# Altium project BLE_product-v1.2.PrjPcb
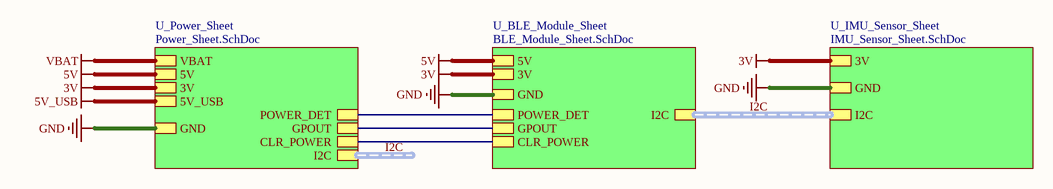
[diagram p0: Top_Sheet.SchDoc]
4 sheets, 45 parts. Net scope: hierarchical (ports join the sheet entries above them; power ports are global).
Board file: BLE_product-v1.2.PcbDoc
Sheets:
  Top_Sheet.SchDoc
    U_BLE_Module_Sheet = BLE_Module_Sheet.SchDoc
    U_IMU_Sensor_Sheet = IMU_Sensor_Sheet.SchDoc
    U_Power_Sheet = Power_Sheet.SchDoc

## Sheet Top_Sheet.SchDoc
size A4; SheetNumber: 1; SheetTotal: 4

### Sub-sheets
U_BLE_Module_Sheet = BLE_Module_Sheet.SchDoc: POWER_DET, 5V, GND, 3V, I2C (harness I2C), CLR_POWER, GPOUT
U_IMU_Sensor_Sheet = IMU_Sensor_Sheet.SchDoc: GND, 3V, I2C (harness I2C)
U_Power_Sheet = Power_Sheet.SchDoc: VBAT, 5V, GND, 3V, POWER_DET, CLR_POWER, 5V_USB, GPOUT, I2C (harness I2C)

### Nets
3V: sheet U_BLE_Module_Sheet/3V, sheet U_IMU_Sensor_Sheet/3V, sheet U_Power_Sheet/3V
5V: sheet U_BLE_Module_Sheet/5V, sheet U_Power_Sheet/5V
GND: sheet U_BLE_Module_Sheet/GND, sheet U_IMU_Sensor_Sheet/GND, sheet U_Power_Sheet/GND
CLR_POWER: sheet U_BLE_Module_Sheet/CLR_POWER, sheet U_Power_Sheet/CLR_POWER
GPOUT: sheet U_BLE_Module_Sheet/GPOUT, sheet U_Power_Sheet/GPOUT
POWER_DET: sheet U_BLE_Module_Sheet/POWER_DET, sheet U_Power_Sheet/POWER_DET

### Buses and harness runs
harness I2C = sheet U_BLE_Module_Sheet/I2C = sheet U_IMU_Sensor_Sheet/I2C
harness I2C = sheet U_Power_Sheet/I2C

### Notes on the sheet
- File:
- Title:
- Date:
- Page
- Num:
- Total:
- Drawn By: Huzaifa Ali

## Sheet BLE_Module_Sheet.SchDoc
size A4; SheetNumber: 3; SheetTotal: 4
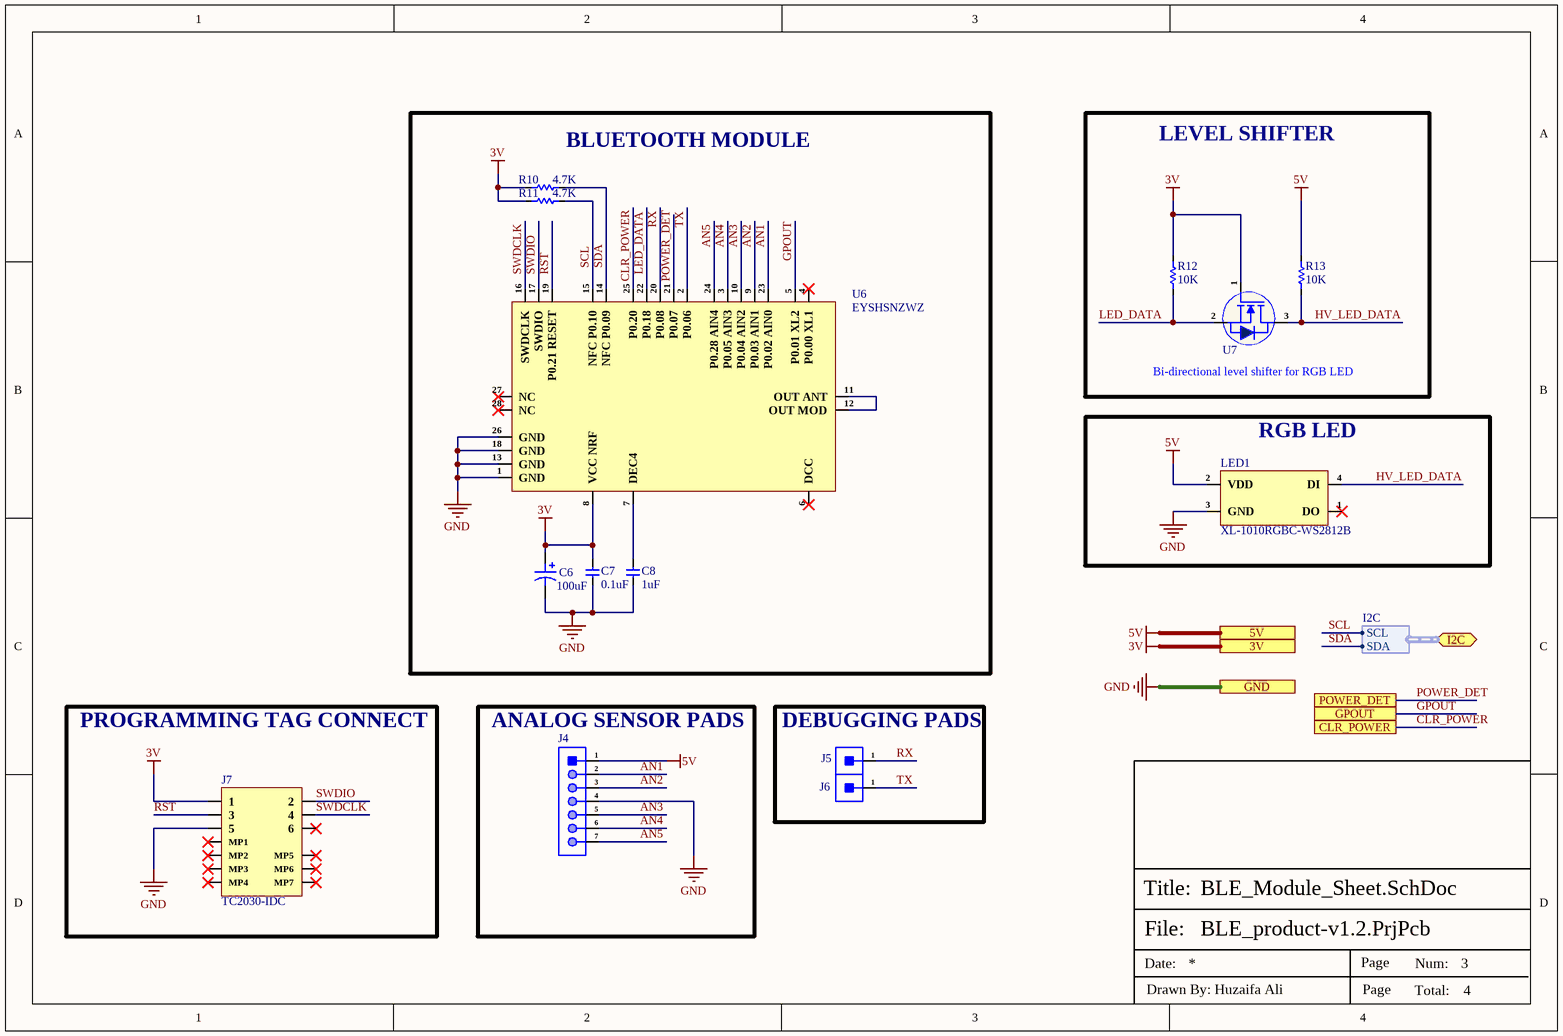
[diagram p1: BLE_Module_Sheet.SchDoc]

### Parts
C6  100uF  [F980J107MMAAXE]
C7  0.1uF  [CAP-0201]
C8  1uF  [CAP-0201]
J4  Sensor Pads 0.5mm Dia  [Sensor-Pads 0.5mm Dia]  (value not drawn)
J5  1 Sensor Pad 0.5mm  [1 Sensor Pad 0.5mm]  (value not drawn)
J6  1 Sensor Pad 0.5mm  [1 Sensor Pad 0.5mm]  (value not drawn)
J7  TC2030-IDC  [TC2030-IDC_]
LED1  XL-1010RGBC-WS2812B  [XL-1010RGBC-WS2812B]
R10  4.7K  [Res-0201]
R11  4.7K  [Res-0201]
R12  10K  [Res-0201]
R13  10K  [Res-0201]
U6  EYSHSNZWZ  [EYSHSNZWZ]
U7  NTNS3193NZT5G  [X-LLGA-3]  (value not drawn)

### Blocks framed on the sheet
BLUETOOTH MODULE: C6-C8 R10 R11 U6
LEVEL SHIFTER: R12 R13 U7
RGB LED: LED1
PROGRAMMING TAG CONNECT: J7
ANALOG SENSOR PADS: J4
DEBUGGING PADS: J5 J6

### Ports
3V, 5V, CLR_POWER, GND, GPOUT, I2C (bidir, harness I2C), POWER_DET

### Harnesses
I2C: SDA, SCL

### Nets
3V: C6.1 C7.2 J7.1 R10.2 R11.2 R12.2 U6.8(VCC_NRF) U7.1(G) ; port 3V
5V: J4.1 LED1.2(VDD) R13.2 ; port 5V
GND: C6.2 C7.1 C8.1 J4.4 J7.5 LED1.3(GND) U6.1(GND) U6.13(GND) U6.18(GND) U6.26(GND) ; port GND
AN1: J4.2 U6.23(P0.02_AIN0)
AN2: J4.3 U6.9(P0.03_AIN1)
AN3: J4.5 U6.10(P0.04_AIN2)
AN4: J4.6 U6.3(P0.05_AIN3)
AN5: J4.7 U6.24(P0.28_AIN4)
CLR_POWER: U6.25(P0.20) ; port CLR_POWER
GPOUT: U6.5(P0.01_XL2) ; port GPOUT
HV_LED_DATA: LED1.4(DI) R13.1 U7.3(D)
LED_DATA: R12.1 U6.22(P0.18) U7.2(S)
POWER_DET: U6.21(P0.07) ; port POWER_DET
RST: J7.3 U6.19(P0.21_RESET)
RX: J5.1 U6.20(P0.08)
SCL: R11.1 U6.15(NFC_P0.10) ; port I2C.SCL  [project net I2C.SCL]
SDA: R10.1 U6.14(NFC_P0.09) ; port I2C.SDA  [project net I2C.SDA]
SWDCLK: J7.4 U6.16(SWDCLK)
SWDIO: J7.2 U6.17(SWDIO)
TX: J6.1 U6.2(P0.06)
NetC8_2: C8.2 U6.7(DEC4)
NetU6_11: U6.11(OUT_ANT) U6.12(OUT_MOD)

Not connected (* = marked no-connect by the designer): J7 6* MP1* MP2* MP3* MP4* MP5* MP6* MP7*; LED1 1(DO)*; U6 4(P0.00_XL1)* 6(DCC)* 27(NC)* 28(NC)*

### Notes on the sheet
- (near U7) Bi-directional level shifter for RGB LED
- File:
- Title:
- Date:
- Page
- Num:
- Total:
- Drawn By: Huzaifa Ali

### Library data of the parts
C6 = F980J107MMAAXE: CAP TANT 100UF 20% 6.3V 0603; Manufacturer: Kyocera AVX; Item Type: Capacitor; Supplier: Digi-Key; Supplier Part Number: 478-9836-1-ND; Manufacturer Part Number: F980J107MMAAXE; RoHS: Yes; Category: Tantalum Capacitors; Stock: 133089; Pricing: 1=0.71, 10=0.505, 50=0.382, 100=0.3327, 500=0.24644, 1000=0.20947 (USD); ComponentLink1URL: http://www.farnell.com/datasheets/2602422.pdf?src-supplier=Farnell; ComponentLink1Description: http://www.farnell.com/datasheets/2602422.pdf?src-supplier=Farnell; ComponentLink2URL: https://datasheet.octopart.com/F980J107MMAAXE-AVX-datasheet-104407997.pdf?src-supplier=Newark; ComponentLink2Description: https://datasheet.octopart.com/F980J107MMAAXE-AVX-datasheet-104407997.pdf?src-supplier=Newark; ComponentLink3URL: https://datasheet.octopart.com/F980J107MMAAXE-KYOCERA-AVX-datasheet-57254939.pdf?src-supplier=Future+Electronics; ComponentLink3Description: https://datasheet.octopart.com/F980J107MMAAXE-KYOCERA-AVX-datasheet-57254939.pdf?src-supplier=Future+Electronics; ComponentLink4URL: http://datasheets.avx.com/F98.pdf?src-supplier=Digi-Key; ComponentLink4Description: http://datasheets.avx.com/F98.pdf?src-supplier=Digi-Key; ComponentLink5URL: http://www.farnell.com/datasheets/2649022.pdf?src-supplier=Newark; ComponentLink5Description: http://www.farnell.com/datasheets/2649022.pdf?src-supplier=Newark; LCSC Part Number: C1955164
C7 = CC0201KRX5R6BB104: CAP CER 0.1UF 10V X5R 0201; Manufacturer: Yageo; Capacitance: 100nF; Tolerance: 10%; Supplier 1: Mouser; Manufacturer Part Number: CC0201KRX5R6BB104; RoHS: Yes; Category: Ceramic Capacitors; Stock 1: 824403; Pricing 1: 1=0.10000, 10=0.02400, 50=0.02400, 100=0.01900, 1000=0.01100, 10000=0.00900 (USD); Mount: Surface Mount; Case/Package: 0201; Case Code (Imperial): 0201; Case Code (Metric): 0603; Weight: 6E-06oz; Min Operating Temperature: -55°C; Max Operating Temperature: 85°C; Dielectric: X5R; Voltage Rating (DC): 10V; Packaging: Tape and Reel; Termination: SMD/SMT; Resistor Type: Ceramic; Voltage Rating: 10V; Series: CC; Construction: Flat; Length: 0.6mm; Width: 0.012inch; Height: 0.3mm; Thickness: 0.013inch; Depth: 0.3mm; Radiation Hardening: No; Lead Free: Lead Free; Halogen Free: Halogen Free; RoHS Compliant: Yes; ComponentLink1URL: https://datasheet.ciiva.com/11587/upy-gphc-x5r-4v-to-50v-12-11587190.pdf?src-supplier=Avnet; ComponentLink1Description: https://datasheet.ciiva.com/11587/upy-gphc-x5r-4v-to-50v-12-11587190.pdf?src-supplier=Avnet; Supplier Part Number 1: 603-CC201KRX5R6BB104; LCSC Part Number: C190183
C8 = CC0201MRX5R7BB105: CAP CER 1UF 16V X5R 0201; Manufacturer: Yageo; Item Type: Capacitor; Supplier: Digi-Key; Supplier Part Number: 13-CC0201MRX5R7BB105TR-ND; Manufacturer Part Number: CC0201MRX5R7BB105; RoHS: Yes; Category: Ceramic Capacitors; LCSC Part Number: C5182464
J4 = Sensor Pads 0.5mm Dia: Wire Connecting Pad; Item Type: SMD Pads; Manufacturer Part Number: Sensor Pads
J5 J6 = 1 Sensor Pad 0.5mm: Wire Connecting Pad 0.5mm; Item Type: SMD Pad; Manufacturer Part Number: 1 Sensor Pad 0.5mm
J7 = TC2030-IDC: CABLE ADAPTER 6 POS; Manufacturer: Tag-Connect; ComponentLink1URL: http://www.tag-connect.com/Materials/TC2030-MCP%20Datasheet.pdf?src-supplier=Digi-Key; ComponentLink1Description: http://www.tag-connect.com/Materials/TC2030-MCP%20Datasheet.pdf?src-supplier=Digi-Key; Supplier 1: Digi-Key; Manufacturer Part Number: TC2030-IDC; Stock 1: 284; Pricing 1: 1=43.71 (USD); Package Quantity: 1; Supplier Part Number 1: TC2030-IDC-ND
LED1 = XL-1010RGBC-WS2812B: Colorless transparence -40℃~+150℃ 正贴 RGB 120° 1010 Light Emitting Diodes (LED) ROHS; Manufacturer: XINGLIGHT; Item Type: RGB LED; Manufacturer Part Number: XL-1010RGBC-WS2812B; Package: 1010; LCSC Part Number: C5349953; ComponentLink1Description: LCSC; ComponentLink1URL: https://www.lcsc.com/product-detail/Light-Emitting-Diodes-LED_XINGLIGHT-XL-1010RGBC-WS2812B_C5349953.html
R10 R11 = RC0201FR-074K7L: RES 4.7K OHM 1% 1/20W 0201; Manufacturer: Yageo; Item Type: Resistor; Supplier: Future Electronics; Supplier Part Number: 7537285; Manufacturer Part Number: RC0201FR-074K7L; RoHS: Yes; Category: Chip SMD Resistors; Stock: 1610000; Pricing: 10000=0.0014, 50000=0.0013, 250000=0.0013, 750000=0.0012, 2000000=0.0011 (USD); ComponentLink1URL: https://datasheet.ciiva.com/2493/pyu-r-int-thick-7-2493811.pdf?src-supplier=Digi-Key; ComponentLink1Description: https://datasheet.ciiva.com/2493/pyu-r-int-thick-7-2493811.pdf?src-supplier=Digi-Key; ComponentLink2URL: https://datasheet.ciiva.com/2493/pyu-r-int-thick-7-2493812.pdf?src-supplier=Digi-Key; ComponentLink2Description: https://datasheet.ciiva.com/2493/pyu-r-int-thick-7-2493812.pdf?src-supplier=Digi-Key; ComponentLink3URL: https://datasheet.ciiva.com/2493/pyu-r-int-thick-7-2493813.pdf?src-supplier=Digi-Key; ComponentLink3Description: https://datasheet.ciiva.com/2493/pyu-r-int-thick-7-2493813.pdf?src-supplier=Digi-Key; ComponentLink4URL: https://datasheet.ciiva.com/8892/pyu-rc0201-51-rohs-l-8-8892942.pdf?src-supplier=Avnet; ComponentLink4Description: https://datasheet.ciiva.com/8892/pyu-rc0201-51-rohs-l-8-8892942.pdf?src-supplier=Avnet; ComponentLink5URL: https://datasheet.ciiva.com/7672/1563626-7672233.pdf?src-supplier=Element14; ComponentLink5Description: https://datasheet.ciiva.com/7672/1563626-7672233.pdf?src-supplier=Element14; LCSC Part Number: C138135
R12 R13 = RC0201JR-0710KL: RES SMD 10K OHM 5% 1/20W 0201; Manufacturer: Yageo; Voltage Rating (DC): 25V; Power Rating: 50mW; Resistance: 10kR; Temperature Coefficient: 200ppm/°C; Case Code (Imperial): 0201; Case Code (Metric): 0603; Case/Package: 0201; Category: Chip SMD Resistors; Contact Plating: Tin,Matte; Depth: 0.3mm; Lead Free: Lead Free; Length: 0.6mm; Manufacturer Part Number: RC0201JR-0710KL; Max Operating Temperature: 125°C; Military Standard: Not; Min Operating Temperature: -55°C; Packaging: Tape and Reel; Radiation Hardening: No; REACH SVHC: Unknown; Resistor Type: Thick Film; Termination: SMD/SMT; Tolerance: 5%; Voltage Rating: 25V; ComponentLink1Description: New link; ComponentLink1URL: *; Supplier 1: Digi-Key; RoHS: Yes; Stock 1: 1488597; Pricing 1: 1=0.10000, 10=0.02600, 100=0.01050, 1000=0.00472, 2500=0.00410, 5000=0.00338 (USD); ComponentLink2URL: https://datasheet.ciiva.com/8891/pyu-rc0201-51-rohs-l-8-8891388.pdf?src-supplier=Avnet; ComponentLink2Description: https://datasheet.ciiva.com/8891/pyu-rc0201-51-rohs-l-8-8891388.pdf?src-supplier=Avnet; ComponentLink3URL: https://datasheet.ciiva.com/7672/1563626-7672253.pdf?src-supplier=Element14; ComponentLink3Description: https://datasheet.ciiva.com/7672/1563626-7672253.pdf?src-supplier=Element14; ComponentLink4URL: https://datasheet.ciiva.com/28405/pyu-rc0201-51-rohs-l-8-28405613.pdf?src-supplier=Avnet+Europe; ComponentLink4Description: https://datasheet.ciiva.com/28405/pyu-rc0201-51-rohs-l-8-28405613.pdf?src-supplier=Avnet+Europe; ComponentLink5URL: https://datasheet.ciiva.com/7672/1563626-7672254.pdf?src-supplier=Element14; ComponentLink5Description: https://datasheet.ciiva.com/7672/1563626-7672254.pdf?src-supplier=Element14; ComponentLink6URL: https://datasheet.ciiva.com/7660/1421516-7660810.pdf?src-supplier=Element14; ComponentLink6Description: https://datasheet.ciiva.com/7660/1421516-7660810.pdf?src-supplier=Element14; ComponentLink7URL: https://datasheet.ciiva.com/16856/pyu-rc0201-51-rohs-l-8-16856011.pdf?src-supplier=Avnet+Europe; ComponentLink7Description: https://datasheet.ciiva.com/16856/pyu-rc0201-51-rohs-l-8-16856011.pdf?src-supplier=Avnet+Europe; ComponentLink8URL: https://datasheet.ciiva.com/46391/1421516-46391291.pdf?src-supplier=Element14; ComponentLink8Description: https://datasheet.ciiva.com/46391/1421516-46391291.pdf?src-supplier=Element14; Supplier Part Number 1: 311-10KNCT-ND; LCSC Part Number: C138117
U6 = EYSHSNZWZ: RF TXRX MODULE BT TRACE ANT SMD; Manufacturer: Taiyo Yuden; Interface: UART; Frequency: 2.4GHz; Data Rate: 1Mbps; Sensitivity: -94dBm; Memory Size: 64KB; Current - Receiving: 11.7mA; Current - Transmitting: 16mA; Supplier: Farnell; Supplier Part Number: 2889504; Manufacturer Part Number: EYSHSNZWZ; RoHS: Yes; Category: RF Receivers, Transceivers; Pricing: 1=14.18, 10=11.82 (GBP); Mounting Technology: Surface Mount; Case/Package: Module; Min Operating Temperature: -40°C; Max Operating Temperature: 85°C; Packaging: Cut Tape; Series: EYSHSN; RoHS Compliant: Yes; ComponentLink1URL: http://www.yuden.co.jp/to/b0060?src-supplier=Digi-Key; ComponentLink1Description: http://www.yuden.co.jp/to/b0060?src-supplier=Digi-Key
U7 = NTNS3193NZT5G: MOSFET N-CH 20V 224MA 3XLLGA; Manufacturer: ON Semiconductor; Item Type: IC; Supplier: Avnet; Supplier Part Number: NTNS3193NZT5G; Manufacturer Part Number: NTNS3193NZT5G; RoHS: Yes; Category: MOSFETs; Stock: 720374; Pricing: 1405=0.26344, 1500=0.25632, 2900=0.2492, 7100=0.24208, 15000=0.23496, 71000=0.22784, 150000=0.22072 (USD); ComponentLink1URL: https://datasheet.ciiva.com/24010/ntns3193nz-d-260351-24010388.pdf?src-supplier=Mouser; ComponentLink1Description: https://datasheet.ciiva.com/24010/ntns3193nz-d-260351-24010388.pdf?src-supplier=Mouser; ComponentLink2URL: https://datasheet.ciiva.com/30022/ntns3193nz-d-30022416.pdf?src-supplier=Avnet; ComponentLink2Description: https://datasheet.ciiva.com/30022/ntns3193nz-d-30022416.pdf?src-supplier=Avnet; LCSC Part Number: C179628

## Sheet IMU_Sensor_Sheet.SchDoc
size A4; SheetNumber: 4; SheetTotal: 4
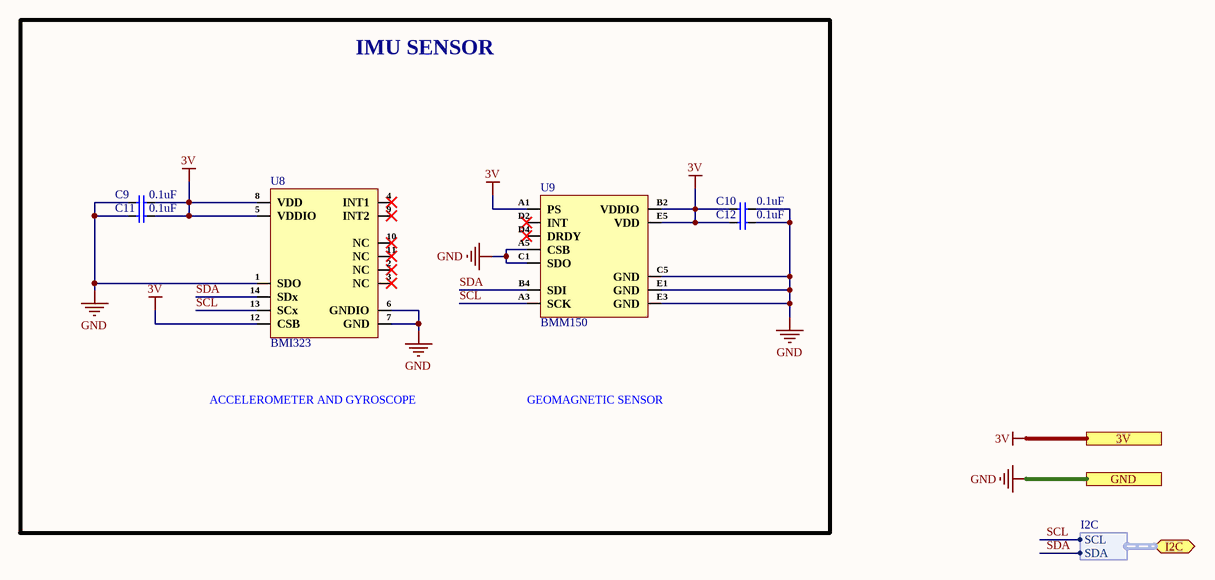
[diagram p2: IMU_Sensor_Sheet.SchDoc]

### Parts
C9  0.1uF  [CAP-0201]
C10  0.1uF  [CAP-0201]
C11  0.1uF  [CAP-0201]
C12  0.1uF  [CAP-0201]
U8  BMI323  [14-LGA (2.5x3)]
U9  BMM150  [12-WLCSP (1.56x1.56)]

### Blocks framed on the sheet
IMU SENSOR: C9-C12 U8 U9

### Ports
3V, GND, I2C (bidir, harness I2C)

### Harnesses
I2C: SDA, SCL

### Nets
3V: C9.2 C10.2 C11.2 C12.2 U8.5(VDDIO) U8.8(VDD) U8.12(CSB) U9.A1(PS) U9.B2(VDDIO) U9.E5(VDD) ; port 3V
GND: C9.1 C10.1 C11.1 C12.1 U8.1(SDO) U8.6(GNDIO) U8.7(GND) U9.A5(CSB) U9.C1(SDO) U9.C5(GND) U9.E1(GND) U9.E3(GND) ; port GND
SCL: U8.13(SCx) U9.A3(SCK) ; port I2C.SCL  [project net I2C.SCL]
SDA: U8.14(SDx) U9.B4(SDI) ; port I2C.SDA  [project net I2C.SDA]

Not connected (* = marked no-connect by the designer): U8 2(NC)* 3(NC)* 4(INT1)* 9(INT2)* 10(NC)* 11(NC)*; U9 D2(INT)* D4(DRDY)*

### Notes on the sheet
- ACCELEROMETER AND GYROSCOPE
- GEOMAGNETIC SENSOR
- File:
- Title:
- Date:
- Page
- Num:
- Total:
- Drawn By: Huzaifa Ali

### Library data of the parts
C9-C12 = CC0201KRX5R6BB104: as C7 on sheet BLE_Module_Sheet; Supplier 1: Mouser; Manufacturer Part Number: CC0201KRX5R6BB104; RoHS: Yes; Category: Ceramic Capacitors; Stock 1: 824403; Pricing 1: 1=0.10000, 10=0.02400, 50=0.02400, 100=0.01900, 1000=0.01100, 10000=0.00900 (USD); Mount: Surface Mount; Case/Package: 0201; Case Code (Imperial): 0201; Case Code (Metric): 0603; Weight: 6E-06oz; Min Operating Temperature: -55°C; Max Operating Temperature: 85°C; Dielectric: X5R; Voltage Rating (DC): 10V; Packaging: Tape and Reel; Termination: SMD/SMT; Resistor Type: Ceramic; Voltage Rating: 10V; Series: CC; Construction: Flat; Length: 0.6mm; Width: 0.012inch; Height: 0.3mm; Thickness: 0.013inch; Depth: 0.3mm; Radiation Hardening: No; Lead Free: Lead Free; Halogen Free: Halogen Free; RoHS Compliant: Yes; ComponentLink1URL: https://datasheet.ciiva.com/11587/upy-gphc-x5r-4v-to-50v-12-11587190.pdf?src-supplier=Avnet; ComponentLink1Description: https://datasheet.ciiva.com/11587/upy-gphc-x5r-4v-to-50v-12-11587190.pdf?src-supplier=Avnet; Supplier Part Number 1: 603-CC201KRX5R6BB104; LCSC Part Number: C190183
U8 = BMI323: IMU ACCEL/GYRO I2C/SPI 14LGA; Manufacturer: Bosch Sensortec; Item Type: IC; Supplier: Future Electronics; Supplier Part Number: 1168362; Manufacturer Part Number: BMI323; RoHS: No; Category: Uncategorized; LCSC Part Number: C5368700
U9 = BMM150: SENSOR FLIPCORE/HALL SPI 12WLCSP; Manufacturer: Bosch Sensortec; Item Type: IC; Supplier: Rs; Supplier Part Number: 2457371; Manufacturer Part Number: BMM150; RoHS: Yes; Category: Magnetic Sensors; Stock: 780; Pricing: 5=1.686, 25=1.598, 100=1.49, 500=1.37, 1000=1.262 (GBP); ComponentLink1URL: https://datasheet.ciiva.com/18575/bst-bmm150-ds001-01-18575453.pdf?src-supplier=Digi-Key; ComponentLink1Description: https://datasheet.ciiva.com/18575/bst-bmm150-ds001-01-18575453.pdf?src-supplier=Digi-Key; LCSC Part Number: C171681

## Sheet Power_Sheet.SchDoc
size A4; SheetNumber: 2; SheetTotal: 4
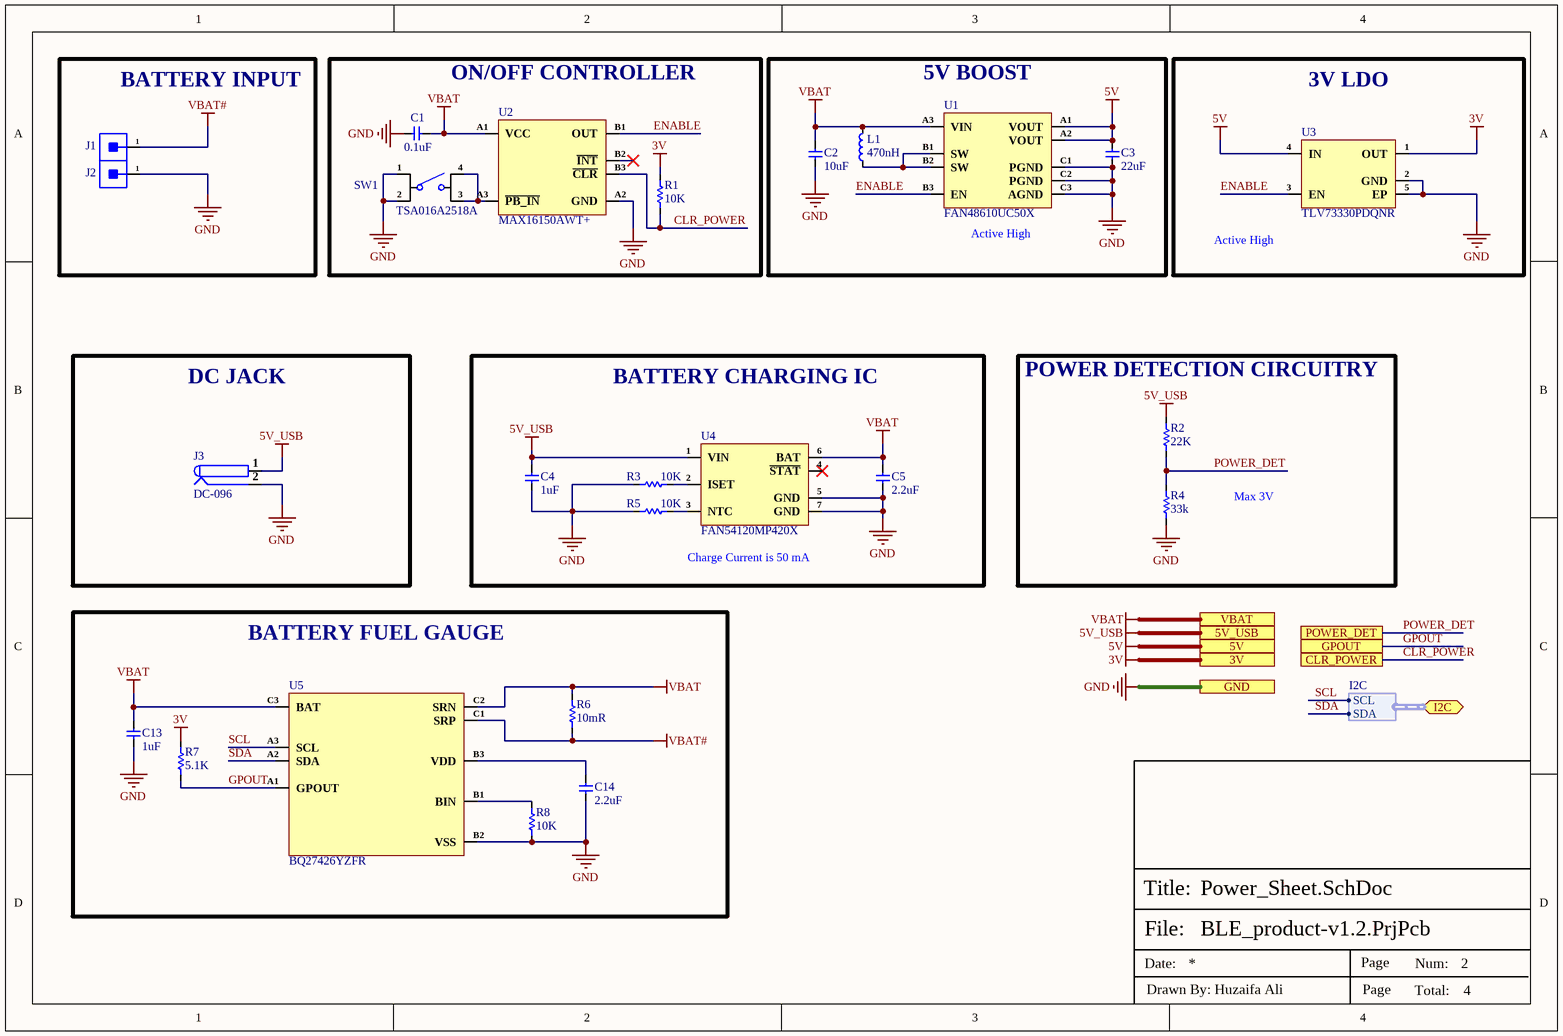
[diagram p3: Power_Sheet.SchDoc]

### Parts
C1  0.1uF  [CAP-0201]
C2  10uF  [Cap-0402]
C3  22uF  [Cap-0603]
C4  1uF  [CAP-0201]
C5  2.2uF  [CAP-0201]
C13  1uF  [CAP-0201]
C14  2.2uF  [CAP-0201]
J1  1 Sensor Pad 0.5mm  [1 Sensor Pad 0.5mm]  (value not drawn)
J2  1 Sensor Pad 0.5mm  [1 Sensor Pad 0.5mm]  (value not drawn)
J3  DC-096  [DC-096]
L1  470nH  [IND-0806]
R1  10K  [Res-0201]
R2  22K  [Res-0201]
R3  10K  [Res-0201]
R4  33k  [Res-0201]
R5  10K  [Res-0201]
R6  10mR  [Res-0402]
R7  5.1K  [Res-0201]
R8  10K  [Res-0201]
SW1  TSA016A2518A  [TSA016A2518A]
U1  FAN48610UC50X  [WLCSP-9 (1.22x1.22)]
U2  MAX16150AWT+  [WLP-6(0.83x1.24)]
U3  TLV73330PDQNR  [X2-SON-4(1x1)]
U4  FAN54120MP420X  [DFN-6-EP(2x2)]
U5  BQ27426YZFR  [DSBGA-9 (1.651x1.61)]

### Blocks framed on the sheet
BATTERY INPUT: J1 J2
ON/OFF CONTROLLER: C1 R1 SW1 U2
5V BOOST: C2 C3 L1 U1
3V LDO: U3
DC JACK: J3
BATTERY CHARGING IC: C4 C5 R3 R5 U4
POWER DETECTION CIRCUITRY: R2 R4
BATTERY FUEL GAUGE: C13 C14 R6-R8 U5

### Ports
3V, 5V, 5V_USB, CLR_POWER, GND, GPOUT, I2C (bidir, harness I2C), POWER_DET, VBAT

### Harnesses
I2C: SDA, SCL

### Nets
3V: R1.2 R7.2 U3.1(OUT) ; port 3V
5V: C3.2 U1.A1(VOUT) U1.A2(VOUT) U3.4(IN) ; port 5V
5V_USB: C4.2 J3.1 R2.2 U4.1(VIN) ; port 5V_USB
GND: C1.1 C2.1 C3.1 C4.1 C5.1 C13.2 C14.1 J2.1 J3.2 R3.2 R4.1 R5.2 R8.2 SW1.1 SW1.2 U1.C1(PGND) U1.C2(PGND) U1.C3(AGND) U2.A2(GND) U3.2(GND) U3.5(EP) U4.5(GND) U4.7(GND) U5.B2(VSS) ; port GND
VBAT: C1.2 C2.2 C5.2 C13.1 L1.2 R6.2 U1.A3(VIN) U2.A1(VCC) U4.6(BAT) U5.C2(SRN) U5.C3(BAT) ; port VBAT
VBAT#: J1.1 R6.1 U5.C1(SRP)
CLR_POWER: R1.1 U2.B3(~{CLR}) ; port CLR_POWER
ENABLE: U1.B3(EN) U2.B1(OUT) U3.3(EN)
GPOUT: R7.1 U5.A1(GPOUT) ; port GPOUT
POWER_DET: R2.1 R4.2 ; port POWER_DET
SCL: U5.A3(SCL) ; port I2C.SCL  [project net I2C.SCL]
SDA: U5.A2(SDA) ; port I2C.SDA  [project net I2C.SDA]
NetC14_2: C14.2 U5.B3(VDD)
NetL1_1: L1.1 U1.B1(SW) U1.B2(SW)
NetR3_1: R3.1 U4.2(ISET)
NetR5_1: R5.1 U4.3(NTC)
NetR8_1: R8.1 U5.B1(BIN)
NetSW1_3: SW1.3 SW1.4 U2.A3(~{PB_IN})

Not connected (* = marked no-connect by the designer): U2 B2(~{INT})*; U4 4(~{STAT})*

### Notes on the sheet
- (near U1) Active High
- (near U3) Active High
- Max 3V
- Charge Current is 50 mA
- File:
- Title:
- Date:
- Page
- Num:
- Total:
- Drawn By: Huzaifa Ali

### Library data of the parts
C1 = CC0201KRX5R6BB104: as C7 on sheet BLE_Module_Sheet; Supplier 1: Mouser; Manufacturer Part Number: CC0201KRX5R6BB104; RoHS: Yes; Category: Ceramic Capacitors; Stock 1: 824403; Pricing 1: 1=0.10000, 10=0.02400, 50=0.02400, 100=0.01900, 1000=0.01100, 10000=0.00900 (USD); Mount: Surface Mount; Case/Package: 0201; Case Code (Imperial): 0201; Case Code (Metric): 0603; Weight: 6E-06oz; Min Operating Temperature: -55°C; Max Operating Temperature: 85°C; Dielectric: X5R; Voltage Rating (DC): 10V; Packaging: Tape and Reel; Termination: SMD/SMT; Resistor Type: Ceramic; Voltage Rating: 10V; Series: CC; Construction: Flat; Length: 0.6mm; Width: 0.012inch; Height: 0.3mm; Thickness: 0.013inch; Depth: 0.3mm; Radiation Hardening: No; Lead Free: Lead Free; Halogen Free: Halogen Free; RoHS Compliant: Yes; ComponentLink1URL: https://datasheet.ciiva.com/11587/upy-gphc-x5r-4v-to-50v-12-11587190.pdf?src-supplier=Avnet; ComponentLink1Description: https://datasheet.ciiva.com/11587/upy-gphc-x5r-4v-to-50v-12-11587190.pdf?src-supplier=Avnet; Supplier Part Number 1: 603-CC201KRX5R6BB104; LCSC Part Number: C190183
C2 = CL05A106MP5NUNC: CAP CER 10UF 10V X5R 0402; Manufacturer: Samsung; Tolerance: 20%; Item Type: Capacitor; Supplier 1: Avnet; Manufacturer Part Number: CL05A106MP5NUNC; RoHS: Yes; Category: Ceramic Capacitors; Stock 1: 1729850; Pricing 1: 10000=0.02537 (USD); Mount: Surface Mount; Case/Package: 0402; Case Code (Metric): 1005; Case Code (Imperial): 0402; Contact Plating: Tin; Min Operating Temperature: -55°C; Max Operating Temperature: 85°C; Package Quantity: 1; Packaging: Tape and Reel; Capacitance: 10uF; Voltage Rating: 10V; Dielectric: X5R; Termination: Wraparound; Series: CL; Construction: Flat; Length: 1mm; Width: 0.02inch; Thickness: 0.028inch; Depth: 0.5mm; Radiation Hardening: No; Lead Free: Lead Free; RoHS Compliant: Yes; ComponentLink1URL: https://datasheet.ciiva.com/25721/cl05a106mp5nunc-25721584.pdf?src-supplier=Digi-Key; ComponentLink1Description: https://datasheet.ciiva.com/25721/cl05a106mp5nunc-25721584.pdf?src-supplier=Digi-Key; ComponentLink2URL: https://datasheet.ciiva.com/26838/getdatasheetpartid-745310-26838170.pdf?src-supplier=Verical; ComponentLink2Description: https://datasheet.ciiva.com/26838/getdatasheetpartid-745310-26838170.pdf?src-supplier=Verical; Supplier Part Number 1: CL05A106MP5NUNC; LCSC Part Number: C315248
C3 = CC0603MRX5R6BB226: CAP CER 22UF 10V X5R 0603; Manufacturer: Yageo; Tolerance: 20%; Item Type: Capacitor; Supplier 1: Digi-Key; Manufacturer Part Number: CC0603MRX5R6BB226; RoHS: Yes; Category: Ceramic Capacitors; Stock 1: 19628; Pricing 1: 1=0.68000, 10=0.48000, 50=0.36300, 100=0.31610, 500=0.23416, 1000=0.19903 (USD); Mount: Surface Mount; Case/Package: 0603; Case Code (Metric): 1608; Case Code (Imperial): 0603; Weight: 7.1E-05oz; Min Operating Temperature: -55°C; Max Operating Temperature: 85°C; Packaging: Tape and Reel; Capacitance: 22uF; Voltage Rating: 10V; Dielectric: X5R; Termination: SMD/SMT; Voltage Rating (DC): 10V; Package Quantity: 4000; Length: 0.063inch; Width: 0.8mm; Height: 0.8mm; Thickness: 0.035inch; Lead Free: Lead Free; Halogen Free: Halogen Free; RoHS Compliant: Yes; ComponentLink1URL: http://www.mouser.com/ds/2/447/Yageo_UPY-GP_NP0_16V-to-50V_9-358835.pdf?src-supplier=Mouser; ComponentLink1Description: http://www.mouser.com/ds/2/447/Yageo_UPY-GP_NP0_16V-to-50V_9-358835.pdf?src-supplier=Mouser; ComponentLink2URL: http://www.yageo.com/documents/recent/UPY-GPHC_X5R_4V-to-50V_25.pdf?src-supplier=Digi-Key; ComponentLink2Description: http://www.yageo.com/documents/recent/UPY-GPHC_X5R_4V-to-50V_25.pdf?src-supplier=Digi-Key; Supplier Part Number 1: 311-1819-1-ND; LCSC Part Number: C109447
C4 = CC0201MRX5R6BB105: CAP CER 1UF 10V X5R 0201; Manufacturer: Yageo; Item Type: Capacitor; Supplier: Digi-Key; Supplier Part Number: 311-3474-1-ND; Manufacturer Part Number: CC0201MRX5R6BB105; RoHS: Yes; Category: Ceramic Capacitors; Stock: 772400; Pricing: 1=0.19, 10=0.135, 50=0.0764, 100=0.0633, 500=0.04436, 1000=0.03672, 2500=0.03418, 5000=0.03127 (USD); ComponentLink1URL: https://datasheet.octopart.com/CC0201MRX5R6BB105-Yageo-datasheet-158238148.pdf?src-supplier=Farnell; ComponentLink1Description: https://datasheet.octopart.com/CC0201MRX5R6BB105-Yageo-datasheet-158238148.pdf?src-supplier=Farnell; ComponentLink2URL: http://www.yageo.com/documents/recent/UPY-GPHC_X5R_4V-to-50V_25.pdf?src-supplier=Digi-Key; ComponentLink2Description: http://www.yageo.com/documents/recent/UPY-GPHC_X5R_4V-to-50V_25.pdf?src-supplier=Digi-Key; ComponentLink3URL: https://datasheet.octopart.com/CC0201MRX5R6BB105-Yageo-datasheet-137700082.pdf?src-supplier=Future+Electronics; ComponentLink3Description: https://datasheet.octopart.com/CC0201MRX5R6BB105-Yageo-datasheet-137700082.pdf?src-supplier=Future+Electronics; LCSC Part Number: C605210
C5 C14 = CC0201MRX5R6BB225: CAP CER 2.2UF 10V X5R 0201; Manufacturer: Yageo; Tolerance: 20%; Item Type: Capacitor; Supplier: Mouser; Supplier Part Number: 603-CC0201MRX56BB225; Manufacturer Part Number: CC0201MRX5R6BB225; RoHS: Yes; Category: Ceramic Capacitors; Stock: 25553; Pricing: 1=0.43, 10=0.294, 50=0.294, 100=0.176, 1000=0.112, 10000=0.091 (USD); Mounting Technology: Surface Mount; Case/Package: 0201; Min Operating Temperature: -55°C; Max Operating Temperature: 85°C; Packaging: Tape and Reel; Value: 2.2uF; Voltage Rating: 10V; Series: CC; RoHS Compliant: Yes; ComponentLink1URL: https://www.yageo.com/upload/media/product/productsearch/datasheet/mlcc/UPY-GPHC_X5R_4V-to-50V_26.pdf?src-supplier=Digi-Key; ComponentLink1Description: https://www.yageo.com/upload/media/product/productsearch/datasheet/mlcc/UPY-GPHC_X5R_4V-to-50V_26.pdf?src-supplier=Digi-Key; LCSC Part Number: C2186869
C13 = CC0201MRX5R7BB105: as C8 on sheet BLE_Module_Sheet; Supplier: Digi-Key; Supplier Part Number: 13-CC0201MRX5R7BB105TR-ND; Manufacturer Part Number: CC0201MRX5R7BB105; RoHS: Yes; Category: Ceramic Capacitors; LCSC Part Number: C5182464
J1 J2 = 1 Sensor Pad 0.5mm: as J5 on sheet BLE_Module_Sheet; Manufacturer Part Number: 1 Sensor Pad 0.5mm
J3 = DC-096: DC Power Jack Socket Female Panel Mount Connector; Manufacturer: CW Switch Elec. Store; Item Type: DC Jack Female; Manufacturer Part Number: DC-096
L1 = 1286AS-H-R47M=P2: FIXED IND 470NH 3.4A 52 MOHM SMD; Manufacturer: Murata; Core Material: Ferrite; Shielding: Shielded; DC Resistance (DCR): 52mR; Test Frequency: 1MHz; Max DC Current: 3.8A; Tolerance: 20%; Item Type: Inductor; Supplier: Digi-Key; Supplier Part Number: 490-10606-1-ND; Manufacturer Part Number: 1286AS-H-R47M=P2; RoHS: Yes; Category: Fixed Inductors; Stock: 12493; Pricing: 1=0.39, 10=0.348, 25=0.3048, 50=0.2612, 100=0.2394, 250=0.21764, 500=0.2046, 1000=0.15671 (USD); Mounting Technology: Surface Mount; Case/Package: 0806; Case Code (Metric): 2016; Case Code (Imperial): 0806; Min Operating Temperature: -40°C; Max Operating Temperature: 85°C; Value: 470nH; Packaging: Cut Tape; Current Rating: 3.4A; Series: DFE201612C; Length: 0.079inch; Width: 0.063inch; Height - Seated (Max): 0.047inch; Depth: 1.6mm; RoHS Compliant: Yes; ComponentLink1URL: http://www.farnell.com/datasheets/2021974.pdf?src-supplier=Farnell; ComponentLink1Description: http://www.farnell.com/datasheets/2021974.pdf?src-supplier=Farnell; ComponentLink2URL: http://www.toko.co.jp/products/pdf/inductors/dfe201612c.pdf?src-supplier=Avnet; ComponentLink2Description: http://www.toko.co.jp/products/pdf/inductors/dfe201612c.pdf?src-supplier=Avnet; ComponentLink3URL: http://search.murata.co.jp/Ceramy/image/img/P02/J(E)TE243A-0010_DFE201612C_reference.pdf?src-supplier=Digi-Key; ComponentLink3Description: http://search.murata.co.jp/Ceramy/image/img/P02/J(E)TE243A-0010_DFE201612C_reference.pdf?src-supplier=Digi-Key; ComponentLink4URL: http://www.toko.co.jp/products/pdf/inductors/dfe201612c.pdf?src-supplier=Digi-Key; ComponentLink4Description: http://www.toko.co.jp/products/pdf/inductors/dfe201612c.pdf?src-supplier=Digi-Key; LCSC Part Number: C160957
R1 R3 R5 R8 = RC0201JR-0710KL: as R12 on sheet BLE_Module_Sheet; Case Code (Imperial): 0201; Case Code (Metric): 0603; Case/Package: 0201; Category: Chip SMD Resistors; Contact Plating: Tin,Matte; Depth: 0.3mm; Lead Free: Lead Free; Length: 0.6mm; Manufacturer Part Number: RC0201JR-0710KL; Max Operating Temperature: 125°C; Military Standard: Not; Min Operating Temperature: -55°C; Packaging: Tape and Reel; Radiation Hardening: No; REACH SVHC: Unknown; Resistor Type: Thick Film; Termination: SMD/SMT; Tolerance: 5%; Voltage Rating: 25V; ComponentLink1Description: New link; ComponentLink1URL: *; Supplier 1: Digi-Key; RoHS: Yes; Stock 1: 1488597; Pricing 1: 1=0.10000, 10=0.02600, 100=0.01050, 1000=0.00472, 2500=0.00410, 5000=0.00338 (USD); ComponentLink2URL: https://datasheet.ciiva.com/8891/pyu-rc0201-51-rohs-l-8-8891388.pdf?src-supplier=Avnet; ComponentLink2Description: https://datasheet.ciiva.com/8891/pyu-rc0201-51-rohs-l-8-8891388.pdf?src-supplier=Avnet; ComponentLink3URL: https://datasheet.ciiva.com/7672/1563626-7672253.pdf?src-supplier=Element14; ComponentLink3Description: https://datasheet.ciiva.com/7672/1563626-7672253.pdf?src-supplier=Element14; ComponentLink4URL: https://datasheet.ciiva.com/28405/pyu-rc0201-51-rohs-l-8-28405613.pdf?src-supplier=Avnet+Europe; ComponentLink4Description: https://datasheet.ciiva.com/28405/pyu-rc0201-51-rohs-l-8-28405613.pdf?src-supplier=Avnet+Europe; ComponentLink5URL: https://datasheet.ciiva.com/7672/1563626-7672254.pdf?src-supplier=Element14; ComponentLink5Description: https://datasheet.ciiva.com/7672/1563626-7672254.pdf?src-supplier=Element14; ComponentLink6URL: https://datasheet.ciiva.com/7660/1421516-7660810.pdf?src-supplier=Element14; ComponentLink6Description: https://datasheet.ciiva.com/7660/1421516-7660810.pdf?src-supplier=Element14; ComponentLink7URL: https://datasheet.ciiva.com/16856/pyu-rc0201-51-rohs-l-8-16856011.pdf?src-supplier=Avnet+Europe; ComponentLink7Description: https://datasheet.ciiva.com/16856/pyu-rc0201-51-rohs-l-8-16856011.pdf?src-supplier=Avnet+Europe; ComponentLink8URL: https://datasheet.ciiva.com/46391/1421516-46391291.pdf?src-supplier=Element14; ComponentLink8Description: https://datasheet.ciiva.com/46391/1421516-46391291.pdf?src-supplier=Element14; Supplier Part Number 1: 311-10KNCT-ND; LCSC Part Number: C138117
R2 = 0201WMF2202TEE: 50mW Thick Film Resistors ±1% ±200ppm/℃ 22kΩ 0201 Chip Resistor - Surface Mount ROHS; Manufacturer: UNI-ROYAL; Manufacturer Part Number: 0201WMF2202TEE; Package: 0201; LCSC Part Number: C473469; Item Type: Resistor; ComponentLink1Description: LCSC; ComponentLink1URL: https://www.lcsc.com/product-detail/Chip-Resistor-Surface-Mount_UNI-ROYAL-Uniroyal-Elec-0201WMF2202TEE_C473469.html
R4 = 0201WMF3302TEE: 50mW Thick Film Resistors ±1% ±200ppm/℃ 33kΩ 0201 Chip Resistor - Surface Mount ROHS; Manufacturer: UNI-ROYAL; Manufacturer Part Number: 0201WMF3302TEE; Package: 0201; LCSC Part Number: C473534; Item Type: Resistor; ComponentLink1Description: LCSC; ComponentLink1URL: https://www.lcsc.com/product-detail/Chip-Resistor-Surface-Mount_UNI-ROYAL-Uniroyal-Elec-0201WMF3302TEE_C473534.html
R6 = PE0402FRF470R01L: RES 0.01 OHM 1% 1/4W 0402; Manufacturer: Yageo; Max Power Dissipation: 250mW; Temperature Coefficient: 100ppm/°C; Item Type: Resistor; Supplier: Digikey; Supplier Part Number: 13-PE0402FRF470R01LDKR-ND; Manufacturer Part Number: PE0402FRF470R01L; RoHS: Yes; Category: Chip SMD Resistors; Pricing: 1=0.87, 10=0.719, 25=0.666, 50=0.6086, 100=0.5006, 250=0.45928, 500=0.3812, 1000=0.31002, 5000=0.29578 (USD); Case/Package: 0402; Min Operating Temperature: -55°C; Max Operating Temperature: 125°C; Package Quantity: 10000; Packaging: Tape and Reel; Value: 10mR; Number of Terminations: 2; Tolerance: 1%; Features: Moisture Resistant,Automotive AEC-Q200; Series: PE; Length: 0.039inch; Width: 0.02inch; Height: 0.02inch; ComponentLink1URL: http://www.mouser.com/ds/2/447/PYu-PE_521_RoHS_L_3-771548.pdf?src-supplier=Mouser; ComponentLink1Description: http://www.mouser.com/ds/2/447/PYu-PE_521_RoHS_L_3-771548.pdf?src-supplier=Mouser; ComponentLink2URL: http://www.yageo.com/documents/recent/PYu-PE_521_RoHS_L_5.pdf?src-supplier=Digikey; ComponentLink2Description: http://www.yageo.com/documents/recent/PYu-PE_521_RoHS_L_5.pdf?src-supplier=Digikey; LCSC Part Number: C851613
R7 = RC0201FR-075K1L: RES 5.1K OHM 1% 1/20W 0201; Manufacturer: Yageo; Power Rating: 50mW; Value: 5.1kR; Voltage Rating: 25V; Temperature Coefficient: 200ppm/°C; Item Type: Resistor; Supplier: Future Electronics; Supplier Part Number: 9072847; Manufacturer Part Number: RC0201FR-075K1L; RoHS: Yes; Category: Chip SMD Resistors; Stock: 280000; Pricing: 10000=0.0014, 40000=0.0013, 200000=0.0013, 400000=0.0012, 1250000=0.0011 (USD); Case/Package: 0201; Case Code (Imperial): 0201; Case Code (Metric): 0603; Min Operating Temperature: -55°C; Max Operating Temperature: 125°C; Packaging: Tape and Reel; Tolerance: 1%; Termination: SMD/SMT; Number of Terminations: 2; Max Power Dissipation: 50mW; Features: Moisture Resistant; Series: RC; Length: 0.6mm; Width: 0.3mm; Height: 0.23mm; Lead Free: Lead Free; RoHS Compliant: Yes; ComponentLink1URL: http://www.mouser.com/ds/2/447/RC0201-559633.pdf?src-supplier=Mouser; ComponentLink1Description: http://www.mouser.com/ds/2/447/RC0201-559633.pdf?src-supplier=Mouser; ComponentLink2URL: https://datasheet.octopart.com/RC0201FR-075K1L-Yageo-datasheet-164759695.pdf?src-supplier=Future+Electronics; ComponentLink2Description: https://datasheet.octopart.com/RC0201FR-075K1L-Yageo-datasheet-164759695.pdf?src-supplier=Future+Electronics; ComponentLink3URL: http://www.yageo.com/documents/recent/PYu-RC_Group_51_RoHS_L_10.pdf?src-supplier=Digi-Key; ComponentLink3Description: http://www.yageo.com/documents/recent/PYu-RC_Group_51_RoHS_L_10.pdf?src-supplier=Digi-Key; LCSC Part Number: C274341
SW1 = TSA016A2518A: 3.35mm 2.5mm Oval button 50mA Brick nogging 4.2mm 180gf 12V SMD Tactile Switches ROHS; Manufacturer: BZCN; Manufacturer Part Number: TSA016A2518A; Package: SMD; LCSC Part Number: C2888427; Item Type: Tactile Switch; ComponentLink1Description: LCSC; ComponentLink1URL: https://jlcpcb.com/partdetail/Bzcn-TSA016A2518A/C2888427
U1 = FAN48610UC50X: IC REG BOOST 5V 1A 9WLCSP; Manufacturer: ON Semiconductor / Fairchild; Supplier: Avnet; Supplier Part Number: FAN48610UC50X; Manufacturer Part Number: FAN48610UC50X; RoHS: Yes; Stock: 1164000; Pricing: 893=0.4144, 900=0.4032, 1800=0.392, 4500=0.3808, 9000=0.3696, 45000=0.3584, 90000=0.3472 (USD); ComponentLink1URL: https://datasheet.ciiva.com/29732/fan48610-29732973.pdf?src-supplier=Digi-Key; ComponentLink1Description: https://datasheet.ciiva.com/29732/fan48610-29732973.pdf?src-supplier=Digi-Key; ComponentLink2URL: https://datasheet.ciiva.com/29732/fan48610-29732983.pdf?src-supplier=Digi-Key; ComponentLink2Description: https://datasheet.ciiva.com/29732/fan48610-29732983.pdf?src-supplier=Digi-Key; ComponentLink3URL: https://datasheet.ciiva.com/30018/fan48610-30018312.pdf?src-supplier=Avnet; ComponentLink3Description: https://datasheet.ciiva.com/30018/fan48610-30018312.pdf?src-supplier=Avnet; LCSC Part Number: C890712; Item Type: IC
U2 = MAX16150AWT+: IC SUPERVISOR 1 CHANNEL 6WLP; Manufacturer: Analog Devices; Supplier: Mouser; Supplier Part Number: 700-MAX16150AWT+; Manufacturer Part Number: MAX16150AWT+; RoHS: No; Category: Voltage Supervisors; Stock: 13; Pricing: 1=3.1, 10=2.78, 50=2.63, 100=2.28, 1000=1.75, 10000=1.69 (USD); LCSC Part Number: C1019998; Item Type: IC
U3 = TLV73330PDQNR: IC REG LINEAR 3V 300MA 4X2SON; Manufacturer: Texas Instruments; Supplier: Mouser; Supplier Part Number: 595-TLV73330PDQNR; Manufacturer Part Number: TLV73330PDQNR; RoHS: Yes; Category: Voltage Regulators - Linear; Stock: 14746; Pricing: 1=0.39, 10=0.255, 50=0.255, 100=0.137, 1000=0.084, 10000=0.058 (USD); ComponentLink1URL: http://www.ti.com/general/docs/suppproductinfo.tsp?distId=10&amp;gotoUrl=http%3A%2F%2Fwww.ti.com%2Flit%2Fgpn%2Ftlv733p&src-supplier=Digi-Key; ComponentLink1Description: http://www.ti.com/general/docs/suppproductinfo.tsp?distId=10&amp;gotoUrl=http%3A%2F%2Fwww.ti.com%2Flit%2Fgpn%2Ftlv733p&src-supplier=Digi-Key; LCSC Part Number: C2870830; Item Type: IC
U4 = FAN54120MP420X: 500Ma Usb Compatible Single Cell Li-Ion Linear Charger With Float Voltage Of 4.2V / Reel; Manufacturer: ON Semiconductor; Item Type: IC; Fault Protection: Over Current,Over Voltage,Short Circuit; Number of Cells: 1; Battery Pack Voltage: 4.5V; Max Supply Voltage: 6V; LCSC Part Number: C890816; ComponentLink1Description: LCSC; ComponentLink1URL: https://www.lcsc.com/product-detail/Battery-Management-ICs_onsemi-FAN54120MP420X_C890816.html; Supplier: Arrow Electronics; Supplier Part Number: FAN54120MP420X; Manufacturer Part Number: FAN54120MP420X; RoHS: Yes; Stock: 3000; Pricing: 3000=0.9606, 6000=0.9252, 12000=0.8029, 15000=0.7598, 24000=0.7093, 30000=0.6852 (USD); Mounting Technology: Surface Mount; Case/Package: DFN; Min Operating Temperature: -30°C; Max Operating Temperature: 85°C; Interface: USB; Series: -; Max Charge Current: 500mA; RoHS Compliant: Yes
U5 = BQ27426YZFR: IC FUEL GAUGE LI-ION 1CL 9DSBGA; Manufacturer: Texas Instruments; Supplier: Mouser; Supplier Part Number: 595-BQ27426YZFR; Manufacturer Part Number: BQ27426YZFR; RoHS: Yes; Category: Battery Management; Stock: 3166; Pricing: 1=1.63, 10=1.47, 50=1.47, 100=1.18, 1000=0.877, 10000=0.694 (USD); ComponentLink1URL: http://www.ti.com/lit/pdf/sluubb0?src-supplier=Digikey; ComponentLink1Description: http://www.ti.com/lit/pdf/sluubb0?src-supplier=Digikey; ComponentLink2URL: http://www.ti.com/lit/gpn/bq27426?src-supplier=Mouser; ComponentLink2Description: http://www.ti.com/lit/gpn/bq27426?src-supplier=Mouser; LCSC Part Number: C165137; Item Type: IC

## Nets that join several sheets
3V: BLE_Module_Sheet (8 pins), IMU_Sensor_Sheet (10 pins), Power_Sheet (R1.2 R7.2 U3.1)
5V: BLE_Module_Sheet (J4.1 LED1.2 R13.2), Power_Sheet (C3.2 U1.A1 U1.A2 U3.4)
GND: BLE_Module_Sheet (10 pins), IMU_Sensor_Sheet (12 pins), Power_Sheet (24 pins)
CLR_POWER: BLE_Module_Sheet (U6.25), Power_Sheet (R1.1 U2.B3)
GPOUT: BLE_Module_Sheet (U6.5), Power_Sheet (R7.1 U5.A1)
I2C.SCL: BLE_Module_Sheet (R11.1 U6.15), IMU_Sensor_Sheet (U8.13 U9.A3), Power_Sheet (U5.A3)
I2C.SDA: BLE_Module_Sheet (R10.1 U6.14), IMU_Sensor_Sheet (U8.14 U9.B4), Power_Sheet (U5.A2)
POWER_DET: BLE_Module_Sheet (U6.21), Power_Sheet (R2.1 R4.2)